# EAGLE schematic BDC-REV1 (EAGLE 9.6.2)

## Sheet 1 of 2
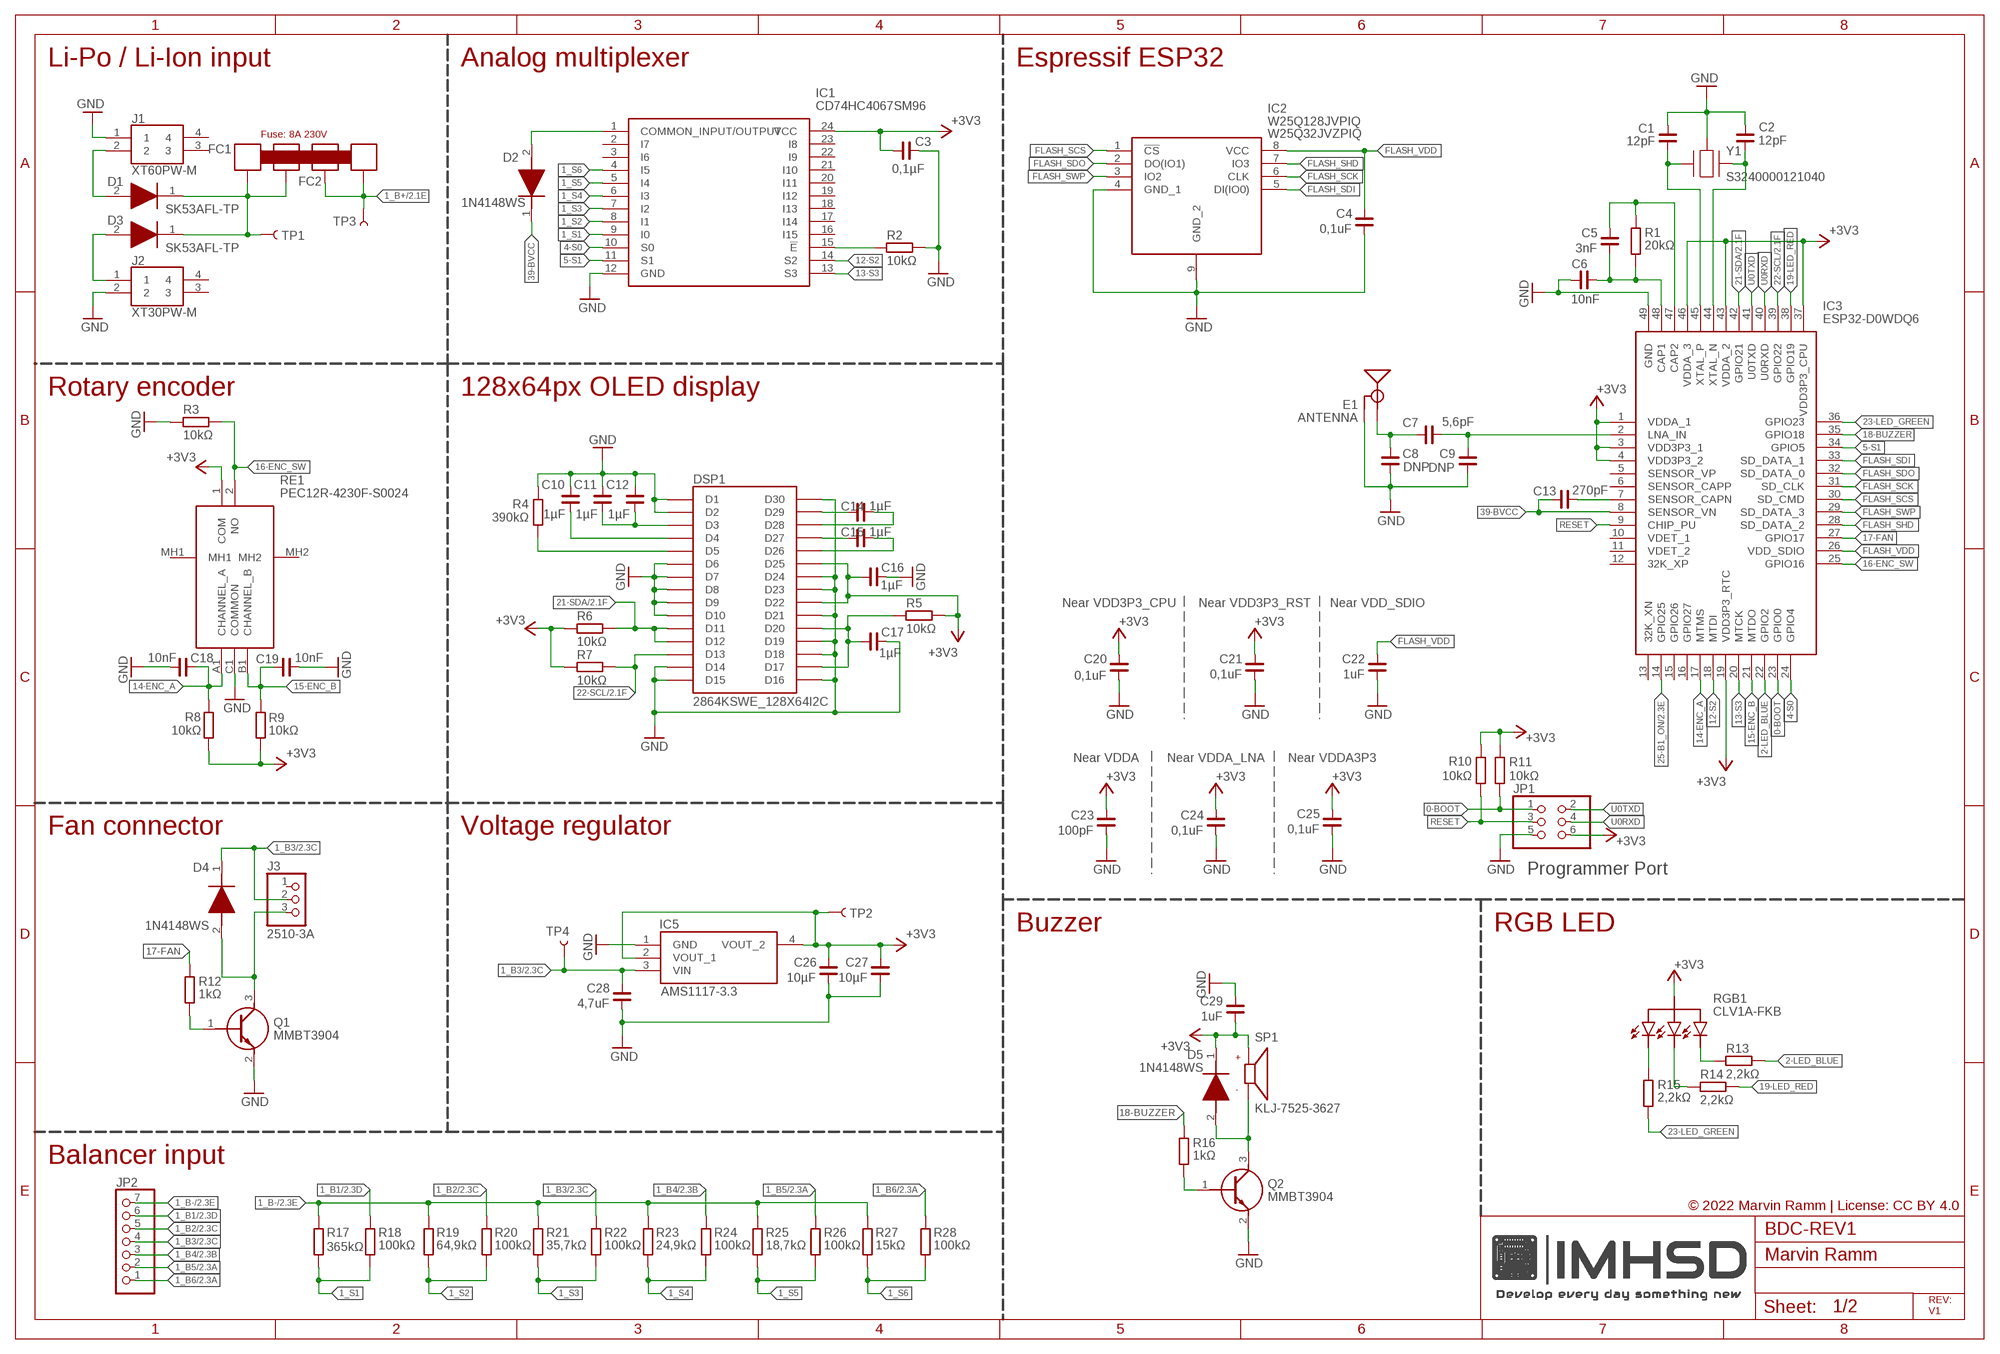
[diagram p0: schematic, sheet 1]

### Parts
C1  12pF  C_0402  [C0402]
C2  12pF  C_0402  [C0402]
C3  0,1µF  C_0402  [C0402]
C4  0,1uF  C_0402  [C0402]
C5  3nF  C_0402  [C0402]
C6  10nF  C_0402  [C0402]
C7  5,6pF  C_0402  [C0402]
C8  DNP  C_0402  [C0402]
C9  DNP  C_0402  [C0402]
C10  1µF  C_0402  [C0402]
C11  1µF  C_0402  [C0402]
C12  1µF  C_0402  [C0402]
C13  270pF  C_0402  [C0402]
C14  1µF  C_0402  [C0402]
C15  1µF  C_0402  [C0402]
C16  1µF  C_0402  [C0402]
C17  1µF  C_0402  [C0402]
C18  10nF  C_0402  [C0402]
C19  10nF  C_0402  [C0402]
C20  0,1uF  C_0402  [C0402]
C21  0,1uF  C_0402  [C0402]
C22  1uF  C_0402  [C0402]
C23  100pF  C_0402  [C0402]
C24  0,1uF  C_0402  [C0402]
C25  0,1uF  C_0402  [C0402]
C26  10µF  C_0603  [C0603]
C27  10µF  C_0603  [C0603]
C28  4,7uF  C_0402  [C0402]
C29  1uF  C_0402  [C0402]
D1  SK53AFL-TP  [SODFL5026X120N]
D2  1N4148WS  [SODFL2512X90N]
D3  SK53AFL-TP  [SODFL5026X120N]
D4  1N4148WS  [SODFL2512X90N]
D5  1N4148WS  [SODFL2512X90N]
DSP1  2864KSWE_128X64I2C  [2864KSWE_128X64I2C]
E1  ANTENNA  ANTENNATRACE-TUNED  [TRACE_ANTENNA_2.4GHZ_25.7MM_TUNED]
FC1  FUSECLIPS  [FUSECLIP]
FC2  FUSECLIPS  [FUSECLIP]
IC1  CD74HC4067SM96  [SOP65P780X200-24N]
IC2  W25Q128JVPIQ  [SON127P800X600X80-9N]
IC3  ESP32-D0WDQ6  [QFN40P600X600X90-49N]
IC5  AMS1117-3.3  [SOT229P700X180-4N]
J1  XT60PW-M  [XT60PWM]
J2  XT30PW-M  [XT30PWM]
J3  2510-3A  [2510-3A]
JP1  PINHD-2X3  [2X03]
JP2  PINHD-1X7/90  [1X07/90]
Q1  MMBT3904  [SOT95P240X120-3N]
Q2  MMBT3904  [SOT95P240X120-3N]
R1  20kΩ  R_0402  [R0402]
R2  10kΩ  R_0402  [R0402]
R3  10kΩ  R_0402  [R0402]
R4  390kΩ  R_0402  [R0402]
R5  10kΩ  R_0402  [R0402]
R6  10kΩ  R_0402  [R0402]
R7  10kΩ  R_0402  [R0402]
R8  10kΩ  R_0402  [R0402]
R9  10kΩ  R_0402  [R0402]
R10  10kΩ  R_0402  [R0402]
R11  10kΩ  R_0402  [R0402]
R12  1kΩ  R_0402  [R0402]
R13  2,2kΩ  R_0402  [R0402]
R14  2,2kΩ  R_0402  [R0402]
R15  2,2kΩ  R_0402  [R0402]
R16  1kΩ  R_0402  [R0402]
R17  365kΩ  R_0402  [R0402]
R18  100kΩ  R_0402  [R0402]
R19  64,9kΩ  R_0402  [R0402]
R20  100kΩ  R_0402  [R0402]
R21  35,7kΩ  R_0402  [R0402]
R22  100kΩ  R_0402  [R0402]
R23  24,9kΩ  R_0402  [R0402]
R24  100kΩ  R_0402  [R0402]
R25  18,7kΩ  R_0402  [R0402]
R26  100kΩ  R_0402  [R0402]
R27  15kΩ  R_0402  [R0402]
R28  100kΩ  R_0402  [R0402]
RE1  PEC12R-4230F-S0024  [PEC12R4230FS0024]
RGB1  RGBLED  [RGBLED]
SP1  CMT-7525-80-SMT-TR  [XDCR_CMT-7525-80-SMT-TR]
TP1  TEST-POINT3X5  [PAD.03X.05]
TP2  TEST-POINT3X5  [PAD.03X.05]
TP3  TEST-POINT3X5  [PAD.03X.05]
TP4  TEST-POINT3X5  [PAD.03X.05]
U$1  40MMFAN  [40MMFAN]
Y1  SMD-3225_4P16MHZ_20PF_10PPM_-4  [SMD3225_4P16MHZ20PF10PPM4085]

### Nets
0-BOOT: IC3.23(GPIO0) JP1.1 R11.2
1_B1: JP2.6 R18.1 ; also sheet 2
1_B2: JP2.5 R20.1 ; also sheet 2
1_B3: C28.2 D4.1(K) IC5.3(VIN) J3.2 JP2.4 R22.1 TP4.P$1 ; also sheet 2
1_B4: JP2.3 R24.1 ; also sheet 2
1_B5: JP2.2 R26.1 ; also sheet 2
1_B6: JP2.1 R28.1 ; also sheet 2
1_B+: FC2.P1 FC2.P2 TP3.P$1 ; also sheet 2
1_B-: JP2.7 R17.1 R19.1 R21.1 R23.1 R25.1 R27.1 ; also sheet 2
1_S1: IC1.9(I0) R17.2 R18.2
1_S2: IC1.8(I1) R19.2 R20.2
1_S3: IC1.7(I2) R21.2 R22.2
1_S4: IC1.6(I3) R23.2 R24.2
1_S5: IC1.5(I4) R25.2 R26.2
1_S6: IC1.4(I5) R27.2 R28.2
2-LED_BLUE: IC3.22(GPIO2) R13.2
4-S0: IC1.10(S0) IC3.24(GPIO4)
5-S1: IC1.11(S1) IC3.34(GPIO5)
12-S2: IC1.14(S2) IC3.18(MTDI)
13-S3: IC1.13(S3) IC3.20(MTCK)
14-ENC_A: C18.1 IC3.17(MTMS) R8.2 RE1.A1(CHANNEL_A)
15-ENC_B: C19.1 IC3.21(MTDO) R9.2 RE1.B1(CHANNEL_B)
16-ENC_SW: IC3.25(GPIO16) R3.2 RE1.2(NO)
17-FAN: IC3.27(GPIO17) R12.1
18-BUZZER: IC3.35(GPIO18) R16.1
19-LED_RED: IC3.38(GPIO19) R14.2
21-SDA: DSP1.D11 DSP1.D12 IC3.42(GPIO21) R6.2 ; also sheet 2
22-SCL: DSP1.D13 IC3.39(GPIO22) R7.2 ; also sheet 2
23-LED_GREEN: IC3.36(GPIO23) R15.2
25-B1_ON: IC3.14(GPIO25) ; also sheet 2
39-BVCC: C13.1 D2.1(K) IC3.8(SENSOR_VN)
+3V3: C3.1 C16.1 C20.2 C21.2 C23.2 C24.2 C25.2 C26.1 C27.1 C29.1 D5.1(K) DSP1.D22 DSP1.D25 IC1.24(VCC) IC3.1(VDDA_1) IC3.3(VDD3P3_1) IC3.4(VDD3P3_2) IC3.19(VDD3P3_RTC) IC3.37(VDD3P3_CPU) IC3.43(VDDA_2) IC3.46(VDDA_3) IC5.2(VOUT_1) IC5.4(VOUT_2) JP1.6 R5.2 R6.1 R7.1 R8.1 R9.1 R10.2 R11.1 RE1.1(COM) RGB1.+5V SP1.P TP2.P$1 ; also sheet 2
FLASH_SCK: IC2.6(CLK) IC3.31(SD_CLK)
FLASH_SCS: IC2.1(!CS) IC3.30(SD_CMD)
FLASH_SDI: IC2.5(DI(IO0)) IC3.33(SD_DATA_1)
FLASH_SDO: IC2.2(DO(IO1)) IC3.32(SD_DATA_0)
FLASH_SHD: IC2.7(IO3) IC3.28(SD_DATA_2)
FLASH_SWP: IC2.3(IO2) IC3.29(SD_DATA_3)
FLASH_VDD: C4.2 C22.2 IC2.8(VCC) IC3.26(VDD_SDIO)
GND: C1.1 C2.1 C3.2 C4.1 C6.1 C8.1 C9.1 C10.1 C11.1 C12.1 C16.2 C17.2 C18.2 C19.2 C20.1 C21.1 C22.1 C23.1 C24.1 C25.1 C26.2 C27.2 C28.1 C29.2 DSP1.D1 DSP1.D2 DSP1.D6 DSP1.D7 DSP1.D8 DSP1.D9 DSP1.D10 DSP1.D14 DSP1.D15 DSP1.D16 DSP1.D18 DSP1.D19 DSP1.D21 DSP1.D23 DSP1.D24 DSP1.D30 E1.GND E1.GND2(GND) IC1.12(GND) IC2.4(GND_1) IC2.9(GND_2) IC3.49(GND) IC5.1(GND) J1.1 J2.2 JP1.5 Q1.2(E) Q2.2(E) R2.2 R3.1 R4.2 RE1.C1(COMMON) Y1.2(GND_2) Y1.4(GND_2) ; also sheet 2
N$19: D3.2(A) J2.1
N$20: IC1.15(!E) R2.1
N$21: D4.2(A) J3.3 Q1.3(C)
N$22: Q1.1(B) R12.2
N$23: C7.1 C9.2 IC3.2(LNA_IN)
N$24: C5.1 C6.2 IC3.48(CAP1) R1.2
N$25: C5.2 IC3.47(CAP2) R1.1
N$26: C2.2 IC3.44(XTAL_N) Y1.3(CRYSTAL_2)
N$27: C1.2 IC3.45(XTAL_P) Y1.1(CRYSTAL_1)
N$28: C15.1 DSP1.D27
N$29: C7.2 C8.2 E1.ANT(SIGNAL)
N$30: C17.1 DSP1.D17 DSP1.D20 R5.1
N$31: C10.2 DSP1.D4
N$32: C15.2 DSP1.D26
N$33: C11.2 C12.2 DSP1.D3
N$34: DSP1.D5 R4.1
N$35: C14.1 DSP1.D29
N$36: C14.2 DSP1.D28
N$39: C13.2 IC3.7(SENSOR_CAPN)
N$41: D1.2(A) J1.2
N$42: D1.1(K) D3.1(K) FC1.P1 FC1.P2 TP1.P$1
N$43: D2.2(A) IC1.1(COMMON_INPUT/OUTPUT)
N$66: D5.2(A) Q2.3(C) SP1.N
N$69: Q2.1(B) R16.2
N$79: R15.1 RGB1.P3
N$80: R13.1 RGB1.P1
N$81: R14.1 RGB1.P2
RESET: IC3.9(CHIP_PU) JP1.3 R10.1
U0RXD: IC3.40(U0RXD) JP1.4
U0TXD: IC3.41(U0TXD) JP1.2
Unconnected: IC1.2(I7) IC1.3(I6) IC1.16(I15) IC1.17(I14) IC1.18(I13) IC1.19(I12) IC1.20(I11) IC1.21(I10) IC1.22(I9) IC1.23(I8) IC3.5(SENSOR_VP) IC3.6(SENSOR_CAPP) IC3.10(VDET_1) IC3.11(VDET_2) IC3.12(32K_XP) IC3.13(32K_XN) IC3.15(GPIO26) IC3.16(GPIO27) J1.3 J1.4 J2.3 J2.4 J3.1 RE1.MH1 RE1.MH2

### Notes on the sheet
- Li-Po / Li-Ion input | Analog multiplexer | Espressif ESP32
- Fuse: 8A 230V | W25Q32JVZPIQ
- FC1
- FC2 | S3240000121040
- Rotary encoder | 128x64px OLED display
- Near VDD3P3_CPU | Near VDD3P3_RST | Near VDD_SDIO
- Near VDDA | Near VDDA_LNA | Near VDDA3P3
- Fan connector | Voltage regulator
- Programmer Port
- Buzzer | RGB LED
- RGB1
- CLV1A-FKB
- KLJ-7525-3627
- Balancer input
- © 2022 Marvin Ramm | License: CC BY 4.0
- Marvin Ramm
- REV:
  V1

## Sheet 2 of 2
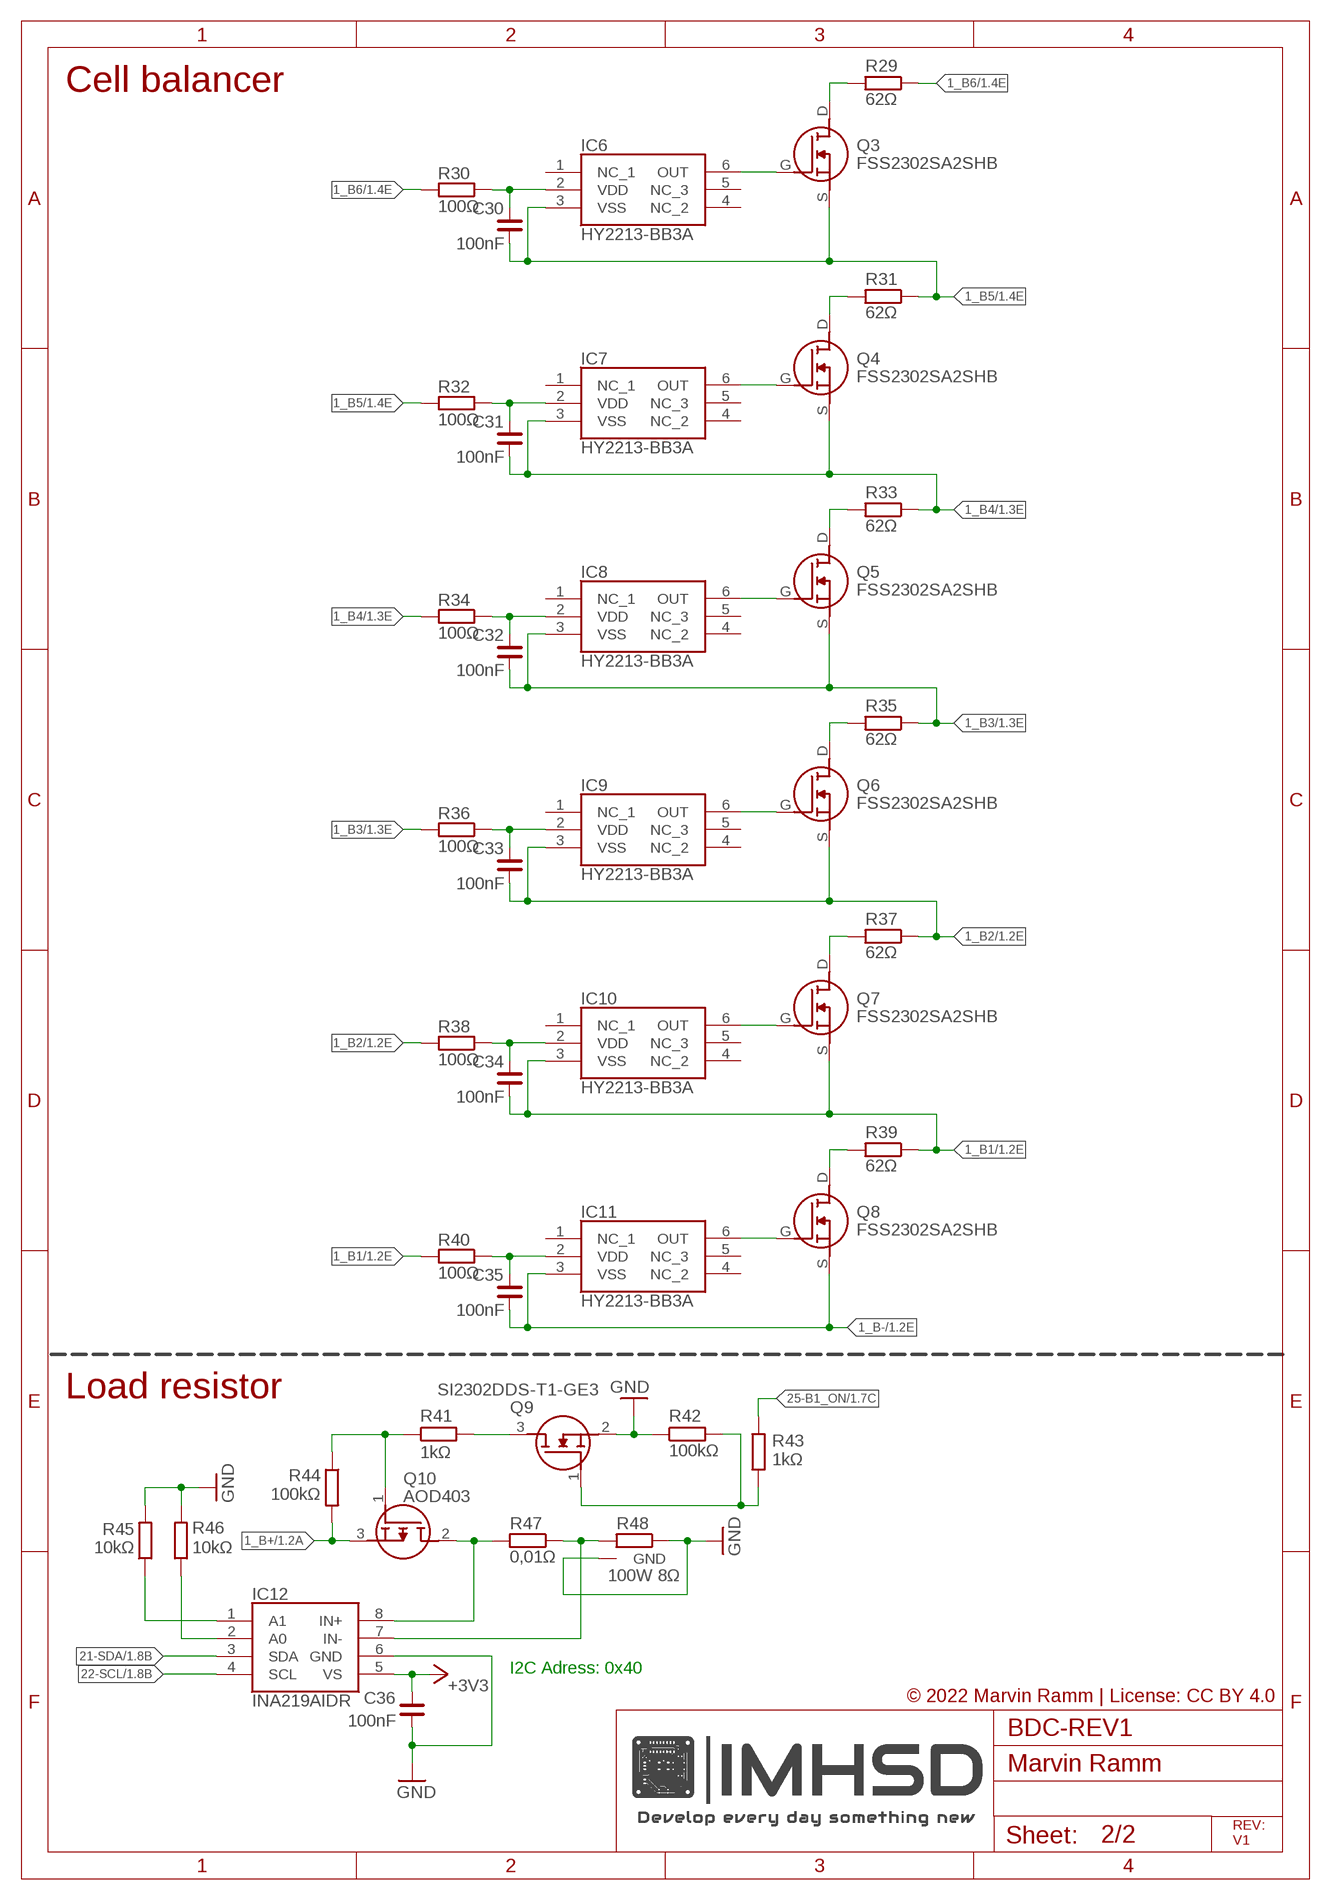
[diagram p1: schematic, sheet 2]

### Parts
C30  100nF  C_0402  [C0402]
C31  100nF  C_0402  [C0402]
C32  100nF  C_0402  [C0402]
C33  100nF  C_0402  [C0402]
C34  100nF  C_0402  [C0402]
C35  100nF  C_0402  [C0402]
C36  100nF  C_0402  [C0402]
IC6  HY2213-BB3A  [SOT95P280X140-6N]
IC7  HY2213-BB3A  [SOT95P280X140-6N]
IC8  HY2213-BB3A  [SOT95P280X140-6N]
IC9  HY2213-BB3A  [SOT95P280X140-6N]
IC10  HY2213-BB3A  [SOT95P280X140-6N]
IC11  HY2213-BB3A  [SOT95P280X140-6N]
IC12  INA219AIDR  [SOIC127P600X175-8N]
Q3  FSS2302SA2SHB  [FSS2302SA2SHB]
Q4  FSS2302SA2SHB  [FSS2302SA2SHB]
Q5  FSS2302SA2SHB  [FSS2302SA2SHB]
Q6  FSS2302SA2SHB  [FSS2302SA2SHB]
Q7  FSS2302SA2SHB  [FSS2302SA2SHB]
Q8  FSS2302SA2SHB  [FSS2302SA2SHB]
Q9  SI2302DDS-T1-GE3  [SOT95P237X112-3N]
Q10  AOD403  [AOD480]
R29  62Ω  R_2512  [R2512]
R30  100Ω  R_0402  [R0402]
R31  62Ω  R_2512  [R2512]
R32  100Ω  R_0402  [R0402]
R33  62Ω  R_2512  [R2512]
R34  100Ω  R_0402  [R0402]
R35  62Ω  R_2512  [R2512]
R36  100Ω  R_0402  [R0402]
R37  62Ω  R_2512  [R2512]
R38  100Ω  R_0402  [R0402]
R39  62Ω  R_2512  [R2512]
R40  100Ω  R_0402  [R0402]
R41  1kΩ  R_0402  [R0402]
R42  100kΩ  R_0402  [R0402]
R43  1kΩ  R_0402  [R0402]
R44  100kΩ  R_0402  [R0402]
R45  10kΩ  R_0402  [R0402]
R46  10kΩ  R_0402  [R0402]
R47  0,01Ω  R_2512  [R2512]
R48  RX24  [RX24_100W]

### Nets
1_B1: C34.2 IC10.3(VSS) Q7.S R39.2 R40.1 ; also sheet 1
1_B2: C33.2 IC9.3(VSS) Q6.S R37.2 R38.1 ; also sheet 1
1_B3: C32.2 IC8.3(VSS) Q5.S R35.2 R36.1 ; also sheet 1
1_B4: C31.2 IC7.3(VSS) Q4.S R33.2 R34.1 ; also sheet 1
1_B5: C30.2 IC6.3(VSS) Q3.S R31.2 R32.1 ; also sheet 1
1_B6: R29.2 R30.1 ; also sheet 1
1_B+: Q10.3(S) R44.1 ; also sheet 1
1_B-: C35.2 IC11.3(VSS) Q8.S ; also sheet 1
21-SDA: IC12.3(SDA) ; also sheet 1
22-SCL: IC12.4(SCL) ; also sheet 1
25-B1_ON: R43.1 ; also sheet 1
+3V3: C36.1 IC12.5(VS) ; also sheet 1
GND: C36.2 IC12.6(GND) Q9.2(S) R42.2 R45.1 R46.1 R48.2 R48.GND R48.GND2(GND) R48.GND3(GND) ; also sheet 1
N$1: Q8.D R39.1
N$2: IC11.6(OUT) Q8.G
N$3: Q7.D R37.1
N$4: C35.1 IC11.2(VDD) R40.2
N$5: IC10.6(OUT) Q7.G
N$6: C34.1 IC10.2(VDD) R38.2
N$7: Q6.D R35.1
N$8: IC9.6(OUT) Q6.G
N$9: C33.1 IC9.2(VDD) R36.2
N$10: Q5.D R33.1
N$11: IC8.6(OUT) Q5.G
N$12: C32.1 IC8.2(VDD) R34.2
N$13: Q4.D R31.1
N$14: IC7.6(OUT) Q4.G
N$15: C31.1 IC7.2(VDD) R32.2
N$16: Q3.D R29.1
N$17: IC6.6(OUT) Q3.G
N$18: C30.1 IC6.2(VDD) R30.2
N$37: Q10.1(G) R41.2 R44.2
N$38: IC12.8(IN+) Q10.2(D) R47.1
N$40: IC12.1(A1) R45.2
N$46: IC12.7(IN-) R47.2 R48.1
N$47: Q9.3(D) R41.1
N$48: Q9.1(G) R42.1 R43.2
N$49: IC12.2(A0) R46.2
Unconnected: IC6.1(NC_1) IC6.4(NC_2) IC6.5(NC_3) IC7.1(NC_1) IC7.4(NC_2) IC7.5(NC_3) IC8.1(NC_1) IC8.4(NC_2) IC8.5(NC_3) IC9.1(NC_1) IC9.4(NC_2) IC9.5(NC_3) IC10.1(NC_1) IC10.4(NC_2) IC10.5(NC_3) IC11.1(NC_1) IC11.4(NC_2) IC11.5(NC_3)

### Notes on the sheet
- Cell balancer
- Load resistor
- 100W 8Ω
- I2C Adress: 0x40
- © 2022 Marvin Ramm | License: CC BY 4.0
- Marvin Ramm
- REV:
  V1

## Library data of the parts
C1-C36 = rc-master-smd:C_: NON-POLARIZED CAP
D1 D3 = SK53AFL-TP:SK53AFL-TP: Schottky Diodes & Rectifiers 5A 30Vr 21Vrms 30V 100A Ifsm .55Vf Source: Datasheet <https://componentsearchengine.com/Datasheets/1/SK53AFL-TP.pdf>; ARROW_PART_NUMBER: SK53AFL-TP; ARROW_PRICE-STOCK: https://www.arrow.com/en/products/sk53afl-tp/micro-commercial-components?region=nac; DESCRIPTION: Schottky Diodes & Rectifiers 5A 30Vr 21Vrms 30V 100A Ifsm .55Vf; HEIGHT: 1.2mm; MANUFACTURER_NAME: Micro Commercial Components (MCC); MANUFACTURER_PART_NUMBER: SK53AFL-TP; MOUSER_PART_NUMBER: 833-SK53AFL-TP; MOUSER_PRICE-STOCK: https://www.mouser.co.uk/ProductDetail/Micro-Commercial-Components-MCC/SK53AFL-TP?qs=T3oQrply3y%2F%2FTb8lb%252B6EMA%3D%3D
D2 D4 D5 = 1N4148WS:1N4148WS: ON Semiconductor Switching Diode, 300mA 75V, 2-Pin SOD-323 1N4148WS Source: Datasheet; ARROW_PART_NUMBER: 1N4148WS; ARROW_PRICE-STOCK: https://www.arrow.com/en/products/1n4148ws/on-semiconductor?region=asia; DESCRIPTION: ON Semiconductor Switching Diode, 300mA 75V, 2-Pin SOD-323 1N4148WS; HEIGHT: 0.9mm; MANUFACTURER_NAME: onsemi; MANUFACTURER_PART_NUMBER: 1N4148WS; MOUSER_PART_NUMBER: 512-1N4148WS; MOUSER_PRICE-STOCK: https://www.mouser.co.uk/ProductDetail/ON-Semiconductor-Fairchild/1N4148WS?qs=2%2FYqgE%252BHg%252BKBrKZlAsMLhw%3D%3D
DSP1 = 2864KSWE_128X64I2C:2864KSWE_128X64I2C
E1 = esp32-thing-temp:ANTENNA: Chip antenna Chip antenna with ground or secondary connection. Common with larger metal RF connectors.
FC1 FC2 = Eigene Library:FUSECLIPS
IC1 = CD74HC4067SM96:CD74HC4067SM96: High Speed CMOS 16-Ch MUX/DEMUX 24P SOIC CD74HC4067SM96, Multiplexer/Demultiplexer Single 16:1, 3 V, 5 V, 24-Pin, SSOP, 1 Source: Datasheet <https://datasheet.datasheetarchive.com/originals/distributors/SFDatasheet-6/sf-000127204.pdf>; ARROW_PART_NUMBER: CD74HC4067SM96; ARROW_PRICE-STOCK: https://www.arrow.com/en/products/cd74hc4067sm96/texas-instruments?region=nac; DESCRIPTION: High Speed CMOS 16-Ch MUX/DEMUX 24P SOIC CD74HC4067SM96, Multiplexer/Demultiplexer Single 16:1, 3 V, 5 V, 24-Pin, SSOP, 1; HEIGHT: 2mm; MANUFACTURER_NAME: Texas Instruments; MANUFACTURER_PART_NUMBER: CD74HC4067SM96; MOUSER_PART_NUMBER: 595-CD74HC4067SM96; MOUSER_PRICE-STOCK: https://www.mouser.co.uk/ProductDetail/Texas-Instruments/CD74HC4067SM96?qs=JHHQeKcAU3DyfvAOSRLjhQ%3D%3D
IC2 = W25Q128JVPIQ:W25Q128JVPIQ: IC FLASH 128M SPI 133MHZ 8WSON Source: Datasheet <https://www.arrow.com/en/products/w25q128jvpiq/winbond-electronics>; ARROW_PART_NUMBER: W25Q128JVPIQ; ARROW_PRICE-STOCK: https://www.arrow.com/en/products/w25q128jvpiq/winbond-electronics?region=nac; DESCRIPTION: IC FLASH 128M SPI 133MHZ 8WSON; HEIGHT: 0.8mm; MANUFACTURER_NAME: Winbond; MANUFACTURER_PART_NUMBER: W25Q128JVPIQ; MOUSER_PART_NUMBER: 454-W25Q128JVPIQ; MOUSER_PRICE-STOCK: https://www.mouser.co.uk/ProductDetail/Winbond/W25Q128JVPIQ?qs=qSfuJ%252Bfl%2Fd676hAD%252B1JSfw%3D%3D
IC3 = ESP32-D0WDQ6:ESP32-D0WDQ6: RF System on a Chip - SoC SMD IC ESP32-D0WDQ6, Dual Core MCU, WiFi & Bluetooth Combo, QFN48-pin, 6*6mm Source: Datasheet <https://www.espressif.com/sites/default/files/documentation/esp32_datasheet_en.pdf>; DESCRIPTION: RF System on a Chip - SoC SMD IC ESP32-D0WDQ6, Dual Core MCU, WiFi & Bluetooth Combo, QFN48-pin, 6*6mm; HEIGHT: 0.9mm; MANUFACTURER_NAME: Espressif Systems; MANUFACTURER_PART_NUMBER: ESP32-D0WDQ6; MOUSER_PART_NUMBER: 356-ESP32-D0WDQ6; MOUSER_PRICE-STOCK: https://www.mouser.co.uk/ProductDetail/Espressif-Systems/ESP32-D0WDQ6?qs=chTDxNqvsykWgzfXx0gR%252BQ%3D%3D
IC5 = AMS1117-3.3:AMS1117-3.3: 1A LOW DROPOUT VOLTAGE REGULATOR, SOT-223 Source: Datasheet <http://www.advanced-monolithic.com/pdf/ds1117.pdf>; ARROW_PART_NUMBER: AMS1117-3.3; DESCRIPTION: 1A LOW DROPOUT VOLTAGE REGULATOR, SOT-223; HEIGHT: 1.8mm; MANUFACTURER_NAME: Advanced Monolithic Systems; MANUFACTURER_PART_NUMBER: AMS1117-3.3
IC6-IC11 = HY2213-BB3A:HY2213-BB3A: PMIC - Battery Management SOT-23-6 RoHS Source: Datasheet <https://datasheet.lcsc.com/szlcsc/HYCON-Tech-HY2213-BB3A_C113632.pdf>; DESCRIPTION: PMIC - Battery Management SOT-23-6 RoHS; HEIGHT: 1.4mm; MANUFACTURER_NAME: Hycon; MANUFACTURER_PART_NUMBER: HY2213-BB3A
IC12 = INA219AIDR:INA219AIDR: 26-V, Bidirectional, Zero-Drift, High-Side, I2C Out Current/Power Monitor Source: Datasheet <http://www.ti.com/lit/gpn/ina219>; ARROW_PART_NUMBER: INA219AIDR; ARROW_PRICE-STOCK: https://www.arrow.com/en/products/ina219aidr/texas-instruments; DESCRIPTION: 26-V, Bidirectional, Zero-Drift, High-Side, I2C Out Current/Power Monitor; HEIGHT: 1.75mm; MANUFACTURER_NAME: Texas Instruments; MANUFACTURER_PART_NUMBER: INA219AIDR; MOUSER_PART_NUMBER: 595-INA219AIDR; MOUSER_PRICE-STOCK: https://www.mouser.co.uk/ProductDetail/Texas-Instruments/INA219AIDR?qs=XGzIaZb%2FFYIE5YcOHTnKDA%3D%3D
J1 = XT60PW-M:XT60PW-M: Socket; DC supply; XT60; male; PIN: 2; on PCBs; THT; Colour: yellow Source: Datasheet <https://www.tme.eu/Document/9b8d0c5eb7094295f3d3112c214d3ade/XT60PW SPEC.pdf>; DESCRIPTION: Socket; DC supply; XT60; male; PIN: 2; on PCBs; THT; Colour: yellow; HEIGHT: 8.4mm; MANUFACTURER_NAME: Changzou Amass Elec; MANUFACTURER_PART_NUMBER: XT60PW-M; SPICEPREFIX: E
J2 = XT30PW-M:XT30PW-M: 30A Low Temperature Rise Fire Retardant Plug Source: Datasheet <https://www.tme.eu/sl/Document/ce4077e36b79046da520ca73227e15de/XT30PW SPEC.pdf>; DESCRIPTION: 30A Low Temperature Rise Fire Retardant Plug; HEIGHT: 5mm; MANUFACTURER_NAME: Amass; MANUFACTURER_PART_NUMBER: XT30PW-M
J3 = pinhead:2510-3A
JP1 = pinhead:PINHD-2X3: PIN HEADER
JP2 = pinhead:PINHD-1X7: PIN HEADER
Q1 Q2 = MMBT3904:MMBT3904: Transistor GP BJT NPN 40V 0.2A SOT23 Fairchild MMBT3904 NPN Bipolar Transistor, 0.2 A, 40 V, 3-Pin SOT-23 Source: Datasheet <https://media.digikey.com/pdf/Data Sheets/ON Semiconductor PDFs/2N3904,MMBT3904,PZT3904.pdf>; ARROW_PART_NUMBER: MMBT3904; ARROW_PRICE-STOCK: https://www.arrow.com/en/products/mmbt3904/on-semiconductor; DESCRIPTION: Transistor GP BJT NPN 40V 0.2A SOT23 Fairchild MMBT3904 NPN Bipolar Transistor, 0.2 A, 40 V, 3-Pin SOT-23; HEIGHT: 1.2mm; MANUFACTURER_NAME: ON Semiconductor; MANUFACTURER_PART_NUMBER: MMBT3904; MOUSER_PART_NUMBER: 512-MMBT3904; MOUSER_PRICE-STOCK: https://www.mouser.co.uk/ProductDetail/ON-Semiconductor-Fairchild/MMBT3904?qs=UMEuL5FsraCg3xKjS4uBJQ%3D%3D
Q3-Q8 = FSS2302SA2SHB:FSS2302SA2SHB: MOSFET P-CH 30V 4.3A SOT23 Source: Datasheet <http://www.aosmd.com/pdfs/datasheet/ao3407a.pdf>; ARROW_PART_NUMBER: AO3407A; ARROW_PRICE-STOCK: https://www.arrow.com/en/products/ao3407a/alpha-and-omega-semiconductor; DESCRIPTION: MOSFET P-CH 30V 4.3A SOT23; HEIGHT: 1.25mm; MANUFACTURER_NAME: Alpha & Omega Semiconductors; MANUFACTURER_PART_NUMBER: AO3407A
Q9 = SI2302DDS-T1-GE3:SI2302DDS-T1-GE3: SI2302DDS-T1-GE3 N-Channel MOSFET, 2.6 A, 20 V, 3-Pin SOT-363 Vishay Source: Datasheet <http://www.vishay.com/docs/63653/si2302dds.pdf>; ARROW_PART_NUMBER: SI2302DDS-T1-GE3; ARROW_PRICE-STOCK: https://www.arrow.com/en/products/si2302dds-t1-ge3/vishay; DESCRIPTION: SI2302DDS-T1-GE3 N-Channel MOSFET, 2.6 A, 20 V, 3-Pin SOT-363 Vishay; HEIGHT: 1.12mm; MANUFACTURER_NAME: Vishay; MANUFACTURER_PART_NUMBER: SI2302DDS-T1-GE3; MOUSER_PART_NUMBER: 78-SI2302DDS-T1-GE3; MOUSER_PRICE-STOCK: https://www.mouser.co.uk/ProductDetail/Vishay-Semiconductors/SI2302DDS-T1-GE3?qs=MxnWX8BLHKdaCSNWhg%252BxLA%3D%3D
Q10 = AOD403:AOD403: MOSFET P-CH 30V 15A TO252 Source: Datasheet <http://aosmd.com/res/data_sheets/AOD403.pdf>; ARROW_PART_NUMBER: AOD403; ARROW_PRICE-STOCK: https://www.arrow.com/en/products/aod403/alpha-and-omega-semiconductor?region=nac; DESCRIPTION: MOSFET P-CH 30V 15A TO252; HEIGHT: 2mm; MANUFACTURER_NAME: Alpha & Omega Semiconductors; MANUFACTURER_PART_NUMBER: AOD403
R1-R47 = rc-master-smd:R_: RESISTOR
R48 = rc-master-smd:RX24
RE1 = PEC12R-4230F-S0024:PEC12R-4230F-S0024: Encoder 30mm Shaft w/Switch 24 pulses Bourns 24 Pulse Incremental Mechanical Rotary Encoder with a 6 mm Flat Shaft, Through Hole Source: Datasheet <http://www.bourns.com/data/global/pdfs/PEC12R.pdf>; ARROW_PART_NUMBER: PEC12R-4230F-S0024; ARROW_PRICE-STOCK: https://www.arrow.com/en/products/pec12r-4230f-s0024/bourns?region=nac; DESCRIPTION: Encoder 30mm Shaft w/Switch 24 pulses Bourns 24 Pulse Incremental Mechanical Rotary Encoder with a 6 mm Flat Shaft, Through Hole; HEIGHT: 30.5mm; MANUFACTURER_NAME: Bourns; MANUFACTURER_PART_NUMBER: PEC12R-4230F-S0024; MOUSER_PART_NUMBER: 652-PEC12R-4230F-S24; MOUSER_PRICE-STOCK: https://www.mouser.co.uk/ProductDetail/Bourns/PEC12R-4230F-S0024?qs=Zq5ylnUbLm78S3yGzO6hng%3D%3D
RGB1 = RGB LED:RGBLED
SP1 = CMT-7525-80-SMT-TR:CMT-7525-80-SMT-TR: CMT-7525-80-SMT-TR Check prices <https://pricing.snapeda.com/parts/CMT-7525-80-SMT-TR/CUI%20Devices/view-part?ref=eda>; AVAILABILITY: Good; CUI_PURCHASE_URL: https://www.cuidevices.com/product/audio/buzzers/audio-transducers/cmt-7525-80-smt-tr?utm_source=snapeda.com&utm_medium=referral&utm_campaign=snapedaBOM; DESCRIPTION: 7.5 mm, 3.6 Vo-p, 80 dB, Surface Mount (SMT), Magnetic Audio Transducer Buzzer; MF: CUI Devices; MP: CMT-7525-80-SMT-TR; PACKAGE: CUI Devices; PRICE: None; PURCHASE-URL: https://pricing.snapeda.com/search/part/CMT-7525-80-SMT-TR/?ref=eda
TP1-TP4 = SparkFun-Connectors:TEST-POINT: SparkFun Test Points Bare copper test points for troubleshooting or In-Circuit-Testing. These are used by our Production team for verifying production board runs using pogo-pins on test beds. SparkFun Products: SparkFun LSM9DS1 Breakout <https://www.sparkfun.com/products/13284> SparkFun PSOC <https://www.sparkfun.com/products/13714> SparkFun Load Cell Amplifier <https://www.sparkfun.com/products/13879>
U$1 = Eigene Library:40MMFAN
Y1 = SMD-3225_4P16MHZ_20PF_10PPM_-4:SMD-3225_4P16MHZ_20PF_10PPM_-4: SMD-3225_4P16MHZ 20PF 10PPM -40~+85 Source: Datasheet <https://datasheet.lcsc.com/szlcsc/Zhejiang-Abel-Elec-SMD-3225-4P-16MHz-20pF-10ppm-40-85_C164049.pdf>; DESCRIPTION: SMD-3225_4P16MHZ 20PF 10PPM -40~+85; HEIGHT: 0.8mm; MANUFACTURER_NAME: TAE(Zhejiang Abel Elec); MANUFACTURER_PART_NUMBER: SMD-3225_4P16MHZ 20PF 10PPM -40~+85℃